# Altium schematic sheet RTC.SchDoc
size A4; SheetNumber: 2; SheetTotal: 2
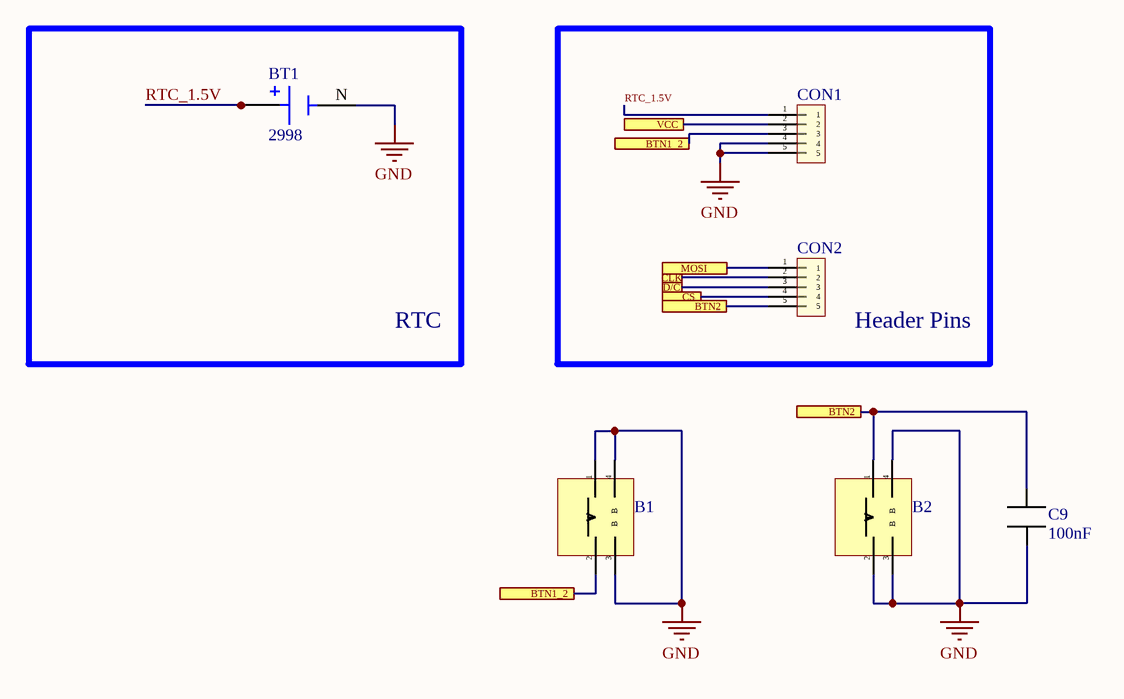
[diagram p0: RTC.SchDoc]

## Parts
B1  COMPONENT_1  [SMD_90degree_booton]  (value not drawn)
B2  COMPONENT_1  [SMD_90degree_booton]  (value not drawn)
BT1  2998  [BAT_2998]
C9  val: 100nF  [CAP_0402]  (hidden comment: CAP_0402)
CON1  CON_1x6_2mm  [CON_1x5_2mm]  (value not drawn)
CON2  CON_1x6_2mm  [CON_1x5_2mm]  (value not drawn)

## Blocks framed on the sheet
RTC: BT1
Header Pins: CON1 CON2

## Ports
BTN1_2 (see RTC[2B]), BTN1_2 (see RTC[2C]), BTN2 (see RTC[2B]), BTN2 (see RTC[2C]), CLK (see OLED[2B]), CS (see OLED[2B]), D/C (see OLED[2B]), MOSI (see OLED[2B]), VCC (see OLED[2B])

## Nets
GND: B1.1 B1.3(B) B1.4(B) B2.2 B2.3(B) B2.4(B) BT1.N(NEG) C9.2 CON1.4 CON1.5
BTN1_2: B1.2 CON1.3 ; port BTN1_2
BTN2: B2.1 C9.1 CON2.5 ; port BTN2
CLK: CON2.2 ; port CLK
CS: CON2.4 ; port CS
D/C: CON2.3 ; port D/C
MOSI: CON2.1 ; port MOSI
RTC_1.5V: BT1.P1(POS) BT1.P2(POS) CON1.1
VCC: CON1.2 ; port VCC

## Library data of the parts
BT1 = 2998: Retenedor de baterÃ­a; SMT; Pila de botÃ³n de 6,8 mm; Bronce fosforado/EstaÃ±o-Niquelado ¦ Keystone Electronics 2998; SnapEDA_Link: https://www.snapeda.com/parts/2998/Keystone/view-part/?ref=snap; Package: None; Value: *; MF: Keystone Electronics; MP: 2998; Check_prices: https://www.snapeda.com/parts/2998/Keystone/view-part/?ref=eda
C9 = CAP_0402: Manufacturer: Taiyo Yuden; Manufacturer Part Number: UMK212B7104KG-T; PCN Part Number: X5R, X7R Dielectrics 23/Jan/2008; Catalog Drawings: xMK Series_0805_1.25; Capacitance: 0.1µF; Tolerance: ±10%; Voltage - Rated: 50V; Temperature Coefficient: X7R; Online Catalog: M Series; Other Names: 587-1279-6; Product Training Modules: Multilayer Ceramic Capacitors; Featured Product: Commodity Multilayer Ceramic Capacitors – CC Series; Standard Package: 1; Category: Capacitors; Family: Ceramic Capacitors; Series: M; Packaging: Digi-Reel®; Mounting Type: Surface Mount, MLCC; Operating Temperature: -55°C ~ 125°C; Applications: General Purpose; Ratings: -; Package / Case: 0805 (2012 Metric); Size / Dimension: 0.079" L x 0.049" W (2.00mm x 1.25mm); Height - Seated (Max): -; Thickness (Max): 0.053" (1.35mm); Lead Spacing: -; Features: -; Lead Style: -; ComponentLink1URL: https://datasheet.ciiva.com/30243/163umk212b7104kg-t-30243740.pdf; ComponentLink1Description: https://datasheet.ciiva.com/30243/163umk212b7104kg-t-30243740.pdf; ComponentLink2URL: https://datasheet.ciiva.com/133/umk212b7104kg-t-ss-133568.pdf; ComponentLink2Description: https://datasheet.ciiva.com/133/umk212b7104kg-t-ss-133568.pdf; ComponentLink3URL: https://datasheet.ciiva.com/28645/746258-28645307.pdf; ComponentLink3Description: https://datasheet.ciiva.com/28645/746258-28645307.pdf; ComponentLink4URL: https://datasheet.ciiva.com/7975/746258-7975900.pdf; ComponentLink4Description: https://datasheet.ciiva.com/7975/746258-7975900.pdf; ComponentLink5URL: https://datasheet.ciiva.com/11786/0900766b80d84f1d-11786009.pdf; ComponentLink5Description: https://datasheet.ciiva.com/11786/0900766b80d84f1d-11786009.pdf; ComponentLink6URL: https://datasheet.ciiva.com/16625/upy-gphc-x7r-6-3v-to-50v-8-16625549.pdf; ComponentLink6Description: https://datasheet.ciiva.com/16625/upy-gphc-x7r-6-3v-to-50v-8-16625549.pdf; ComponentLink7URL: https://datasheet.ciiva.com/155/mlccorderingcode-155931.pdf; ComponentLink7Description: https://datasheet.ciiva.com/155/mlccorderingcode-155931.pdf; ComponentLink8URL: https://datasheet.ciiva.com/46393/1734573-46393307.pdf; ComponentLink8Description: https://datasheet.ciiva.com/46393/1734573-46393307.pdf; ComponentLink9URL: https://datasheet.ciiva.com/155/mlccorderingcode-155930.pdf; ComponentLink9Description: https://datasheet.ciiva.com/155/mlccorderingcode-155930.pdf; ComponentLink10URL: https://datasheet.ciiva.com/28450/1489800-28450805.pdf; ComponentLink10Description: https://datasheet.ciiva.com/28450/1489800-28450805.pdf; ComponentLink11URL: https://datasheet.ciiva.com/11464/upy-gphc-x7r-6-3v-to-50v-8-11464757.pdf; ComponentLink11Description: https://datasheet.ciiva.com/11464/upy-gphc-x7r-6-3v-to-50v-8-11464757.pdf; ComponentLink12URL: https://datasheet.ciiva.com/155/mlccorderingcode-155929.pdf; ComponentLink12Description: https://datasheet.ciiva.com/155/mlccorderingcode-155929.pdf; ComponentLink13URL: https://datasheet.ciiva.com/29242/445210-da-01-en-kerko-chip-0805-x7r-0-1uf-10proz-50vg-29242074.pdf; ComponentLink13Description: https://datasheet.ciiva.com/29242/445210-da-01-en-kerko-chip-0805-x7r-0-1uf-10proz-50vg-29242074.pdf
CON1 CON2 = CON_1x5_2mm